# Altium project DRV8701E_CSD87350Q5D.PrjPcb
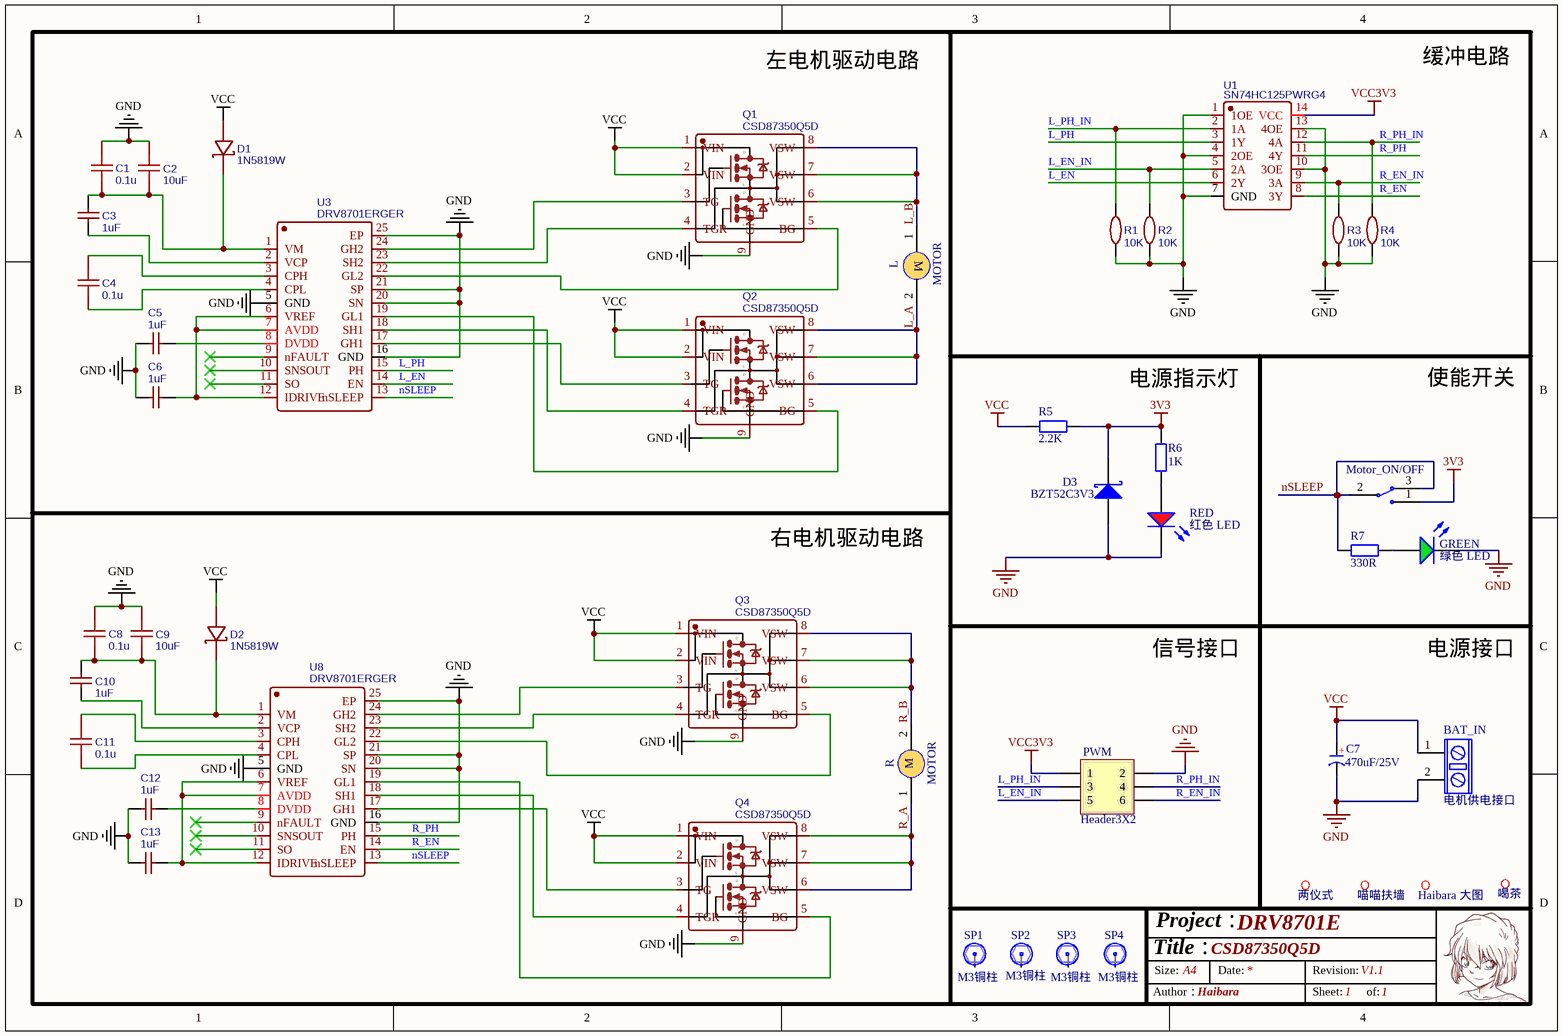
[diagram p0: DRV8701E_CSD87350Q5D.schdoc]
1 sheet, 45 parts. Net scope: global (net labels, ports and power ports of the same name join across sheets).
Board file: DRV8701E_CSD87350Q5D.PcbDoc

## Sheet DRV8701E_CSD87350Q5D.schdoc: CSD87350Q5D
size A4; Revision: V1.1; SheetNumber: 1; SheetTotal: 1; Project: DRV8701E

### Parts
(Parts that share a designator on the sheet are numbered #1, #2 ... from top to bottom, then left to right.)
?#1  两仪式  [两仪式]
?#2  喵喵扶墙  [IMPORTED_IMAGE - duplicate5]
?#3  Haibara 大图  [Haibara大图丝印]
?#4  喝茶  [喝茶]
BAT_IN  电机供电接口  [XT30 母头 电源插头]
C1  0.1u  [C0603]
C2  10uF  [C0805]
C3  1uF  [C0603]
C4  0.1u  [C0603]
C5  1uF  [C0603]
C6  1uF  [C0603]
C7  470uF/25V  [CS 5.0*10*13 - V]
C8  0.1u  [C0603]
C9  10uF  [C0805]
C10  1uF  [C0603]
C11  0.1u  [C0603]
C12  1uF  [C0603]
C13  1uF  [C0603]
D1  1N5819W  [SOD-123F_L2.8-W1.8-LS3.7-RD]
D2  1N5819W  [SOD-123F_L2.8-W1.8-LS3.7-RD]
D3  BZT52C3V3  [SOD-323]
GREEN  绿色 LED  [0603 LED G]
L  MOTOR  [XT30 母头 电源插头]
Motor_ON/OFF  开关  [MTS-102S 两档纽子开关]  (value not drawn)
PWM  Header3X2  [MX 1.25-WS-6P]
Q1  CSD87350Q5D  [LSON-8_L6.0-W5.0-P1.27-LS6.0-TL-EP]
Q2  CSD87350Q5D  [LSON-8_L6.0-W5.0-P1.27-LS6.0-TL-EP]
Q3  CSD87350Q5D  [LSON-8_L6.0-W5.0-P1.27-LS6.0-TL-EP]
Q4  CSD87350Q5D  [LSON-8_L6.0-W5.0-P1.27-LS6.0-TL-EP]
R  MOTOR  [XT30 母头 电源插头]
R1  10K  [R0603]
R2  10K  [R0603]
R3  10K  [R0603]
R4  10K  [R0603]
R5  2.2K  [R0603]
R6  1K  [R0603]
R7  330R  [R0603]
RED  红色 LED  [0603 LED R]
SP1  M3铜柱  [MTGP720H320V6P - duplicate]
SP2  M3铜柱  [MTGP720H320V6P - duplicate]
SP3  M3铜柱  [MTGP720H320V6P - duplicate]
SP4  M3铜柱  [MTGP720H320V6P - duplicate]
U1  SN74HC125PWRG4  [TSSOP-14_L5.0-W4.4-P0.65-LS6.4-TL]
U3  DRV8701ERGER  [VQFN-24_L4.0-W4.0-P0.50-BL-EP2.8]
U8  DRV8701ERGER  [VQFN-24_L4.0-W4.0-P0.50-BL-EP2.8]

### Nets
3V3: D3.2(K) Motor_ON/OFF.1 R5.2 R6.2
GND: BAT_IN.2 C1.2 C2.1 C5.2 C6.2 C7.2(K) C8.2 C9.1 C12.2 C13.1 D3.1(A) GREEN.2 PWM.2 Q1.9(GND) Q2.9(GND) Q3.9(GND) Q4.9(GND) R1.1 R2.1 R3.1 R4.1 RED.2 U1.1(1OE) U1.4(2OE) U1.7(GND) U1.10(3OE) U1.13(4OE) U3.5(GND) U3.16(GND) U3.20(SN) U3.21(SP) U3.25(EP) U8.5(GND) U8.16(GND) U8.20(SN) U8.21(SP) U8.25(EP)
VCC: BAT_IN.1 C7.1(A) D1.2 D2.2 Q1.1(VIN) Q1.2(VIN) Q2.1(VIN) Q2.2(VIN) Q3.1(VIN) Q3.2(VIN) Q4.1(VIN) Q4.2(VIN) R5.1
VCC3V3: PWM.1 U1.14(VCC)
L_A: L.2 Q2.6(VSW) Q2.7(VSW) Q2.8(VSW)
L_B: L.1 Q1.6(VSW) Q1.7(VSW) Q1.8(VSW)
L_EN: U1.6(2Y) U3.14(EN)
L_EN_IN: PWM.5 R2.2 U1.5(2A)
L_PH: U1.3(1Y) U3.15(PH)
L_PH_IN: PWM.3 R1.2 U1.2(1A)
nSLEEP: Motor_ON/OFF.2 Motor_ON/OFF.3 R7.1 U3.13(nSLEEP) U8.13(nSLEEP)
R_A: Q4.6(VSW) Q4.7(VSW) Q4.8(VSW) R.1
R_B: Q3.6(VSW) Q3.7(VSW) Q3.8(VSW) R.2
R_EN: U1.8(3Y) U8.14(EN)
R_EN_IN: PWM.6 R3.2 U1.9(3A)
R_PH: U1.11(4Y) U8.15(PH)
R_PH_IN: PWM.4 R4.2 U1.12(4A)
NetC1_1: C1.1 C2.2 C3.2 D1.1 U3.1(VM)
NetC3_1: C3.1 U3.2(VCP)
NetC4_1: C4.1 U3.4(CPL)
NetC4_2: C4.2 U3.3(CPH)
NetC5_1: C5.1 U3.8(DVDD)
NetC6_1: C6.1 U3.6(VREF) U3.7(AVDD) U3.12(IDRIVE)
NetC8_1: C8.1 C9.2 C10.2 D2.1 U8.1(VM)
NetC10_1: C10.1 U8.2(VCP)
NetC11_1: C11.1 U8.4(CPL)
NetC11_2: C11.2 U8.3(CPH)
NetC12_1: C12.1 U8.8(DVDD)
NetC13_2: C13.2 U8.6(VREF) U8.7(AVDD) U8.12(IDRIVE)
NetGREEN_1: GREEN.1 R7.2
NetQ1_3: Q1.3(TG) U3.24(GH2)
NetQ1_4: Q1.4(TGR) U3.23(SH2)
NetQ1_5: Q1.5(BG) U3.22(GL2)
NetQ2_3: Q2.3(TG) U3.17(GH1)
NetQ2_4: Q2.4(TGR) U3.18(SH1)
NetQ2_5: Q2.5(BG) U3.19(GL1)
NetQ3_3: Q3.3(TG) U8.24(GH2)
NetQ3_4: Q3.4(TGR) U8.23(SH2)
NetQ3_5: Q3.5(BG) U8.22(GL2)
NetQ4_3: Q4.3(TG) U8.17(GH1)
NetQ4_4: Q4.4(TGR) U8.18(SH1)
NetQ4_5: Q4.5(BG) U8.19(GL1)
NetR6_1: R6.1 RED.1

Not connected (* = marked no-connect by the designer): SP1 1; SP2 1; SP3 1; SP4 1; U3 9(nFAULT)* 10(SNSOUT)* 11(SO)*; U8 9(nFAULT)* 10(SNSOUT)* 11(SO)*

### Notes on the sheet
- 左电机驱动电路
- 缓冲电路
- 电源指示灯
- 使能开关
- 右电机驱动电路
- 信号接口
- 电源接口
- Title：
- Size:
- Project：
- A4
- Date:
- Revision:
- Author：
- Haibara
- Sheet:
- of:
- (in symbol CE) +
- (in symbol CSD87350Q5D) D; G; S
- (in symbol MOTOR1) M

### Library data of the parts
C1 C4 C8 C11 = 0.1u: nameAlias: Value(F); Contributor: LCEDA_Lib; spicePre: C; spiceSymbolName: C_0603_US
C2 C9 = 10uF: BOM_Manufacturer: Huaxin S&T; BOM_Manufacturer Part: 0805F106Z160CT; nameAlias: Capacitance; Contributor: LCSC; BOM_Supplier: LCSC; BOM_Supplier Part: C303921; BOM_JLCPCB Part Class: Extended Part; spicePre: C; spiceSymbolName: 0805F106Z160CT
C3 C5 C6 C10 C12 C13 = 1uF: BOM_Manufacturer Part: CL10B105KO8NNNC; BOM_Manufacturer: SAMSUNG; nameAlias: Capacitance; BOM_Supplier: LCSC; BOM_Supplier Part: C59782; BOM_JLCPCB Part Class: Extended Part; spicePre: C; spiceSymbolName: CL10B105KO8NNNC
C7 = CE
D1 D2 = 1N5819W: BOM_Manufacturer: Shandong Jingdao Microelectronics; Contributor: LCSC; BOM_Supplier: LCSC; BOM_Supplier Part: C169540; BOM_Manufacturer Part: 1N5819W; BOM_JLCPCB Part Class: Extended Part; spicePre: D; spiceSymbolName: 1N5819W
D3 = 1N5819: 肖特基二极管; 淘宝ID: 封装库来自淘宝 ID：黄晶宝石; 属性: 40V/2A; BOM名称: 肖特基二极管; 欢迎光临: https://shop463601444.taobao.com
GREEN = 绿灯: 发光二极管; ComponentLink1Description: 供应商链接; ComponentLink1URL: http://www.szlcsc.com/product/details_2670.html; Package: 0805; Supplier: LC; SuppliersPartNumber: C2297
L R = MOTOR1
PWM = Header 3X2: 3*2P接插件; 版权归属: 封装库来自淘宝 ID：黄晶宝石; BOM名称: 3*2P接插件; 学习资源: https://shop463601444.taobao.com
Q1-Q4 = CSD87350Q5D: BOM_Manufacturer: Texas Instruments; Contributor: LCSC; BOM_Supplier: LCSC; BOM_Supplier Part: C140356; BOM_Manufacturer Part: CSD87350Q5D; BOM_JLCPCB Part Class: Extended Part; spicePre: Q; spiceSymbolName: CSD87350Q5D
R1-R4 = 10K: BOM_Manufacturer: YAGEO; BOM_Manufacturer Part: RT0603BRD0710KL; nameAlias: Resistance (Ohms); Resistance: 10kΩ; BOM_Supplier: LCSC; BOM_Supplier Part: C95204; BOM_JLCPCB Part Class: Extended Part; spicePre: R; spiceSymbolName: RT0603BRD0710KL
R5-R7 = R_MPR: 5W无感水泥电阻; BOM名称: 大功率电阻; 版权归属: 封装库来自淘宝 ID：黄晶宝石; 联系售后: https://shop463601444.taobao.com
RED = 红灯: 发光二极管; ComponentLink1Description: 供应商链接; ComponentLink1URL: http://www.szlcsc.com/product/details_2668.html; Package: 0805; Supplier: LC; SuppliersPartNumber: C2295
SP1-SP4 = 铜柱加头大焊盘: 铜柱; 版权归属: 源创客; BOM名称: 铜柱; 学习资源: www.ooocke.com
U1 = SN74HC125PWRG4: BOM_Manufacturer: TI(德州仪器); Contributor: LCSC; BOM_Supplier: LCSC; BOM_Supplier Part: C2676184; BOM_Manufacturer Part: SN74HC125PWRG4; BOM_JLCPCB Part Class: Extended Part; spicePre: U; spiceSymbolName: SN74HC125PWRG4
U3 U8 = DRV8701ERGER: BOM_Manufacturer: Texas Instruments; Contributor: LCSC; BOM_Supplier: LCSC; BOM_Supplier Part: C90964; BOM_Manufacturer Part: DRV8701ERGER; BOM_JLCPCB Part Class: Extended Part; spicePre: U; spiceSymbolName: DRV8701ERGER